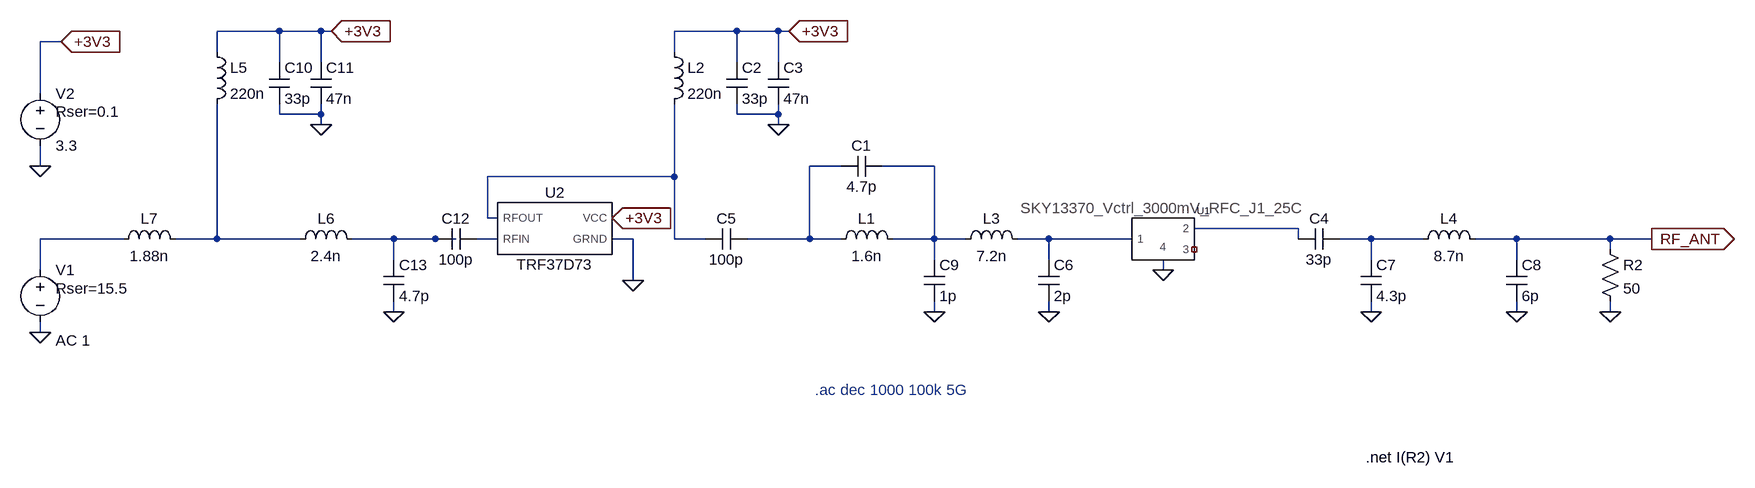
[diagram p0: schematic RF_Front_End_Ideal.asc]
RF_Front_End_Ideal.asc, the LTspice schematic file:
Version 4.1
SHEET 1 1608 680
WIRE -656 -192 -752 -192
WIRE -592 -192 -656 -192
WIRE -576 -192 -592 -192
WIRE 48 -192 -48 -192
WIRE 112 -192 48 -192
WIRE 128 -192 112 -192
WIRE -992 -176 -1024 -176
WIRE -752 -160 -752 -192
WIRE -48 -160 -48 -192
WIRE -656 -144 -656 -192
WIRE -592 -144 -592 -192
WIRE 48 -144 48 -192
WIRE 112 -144 112 -192
WIRE -1024 -96 -1024 -176
WIRE -656 -64 -656 -80
WIRE -592 -64 -592 -80
WIRE -592 -64 -656 -64
WIRE 48 -64 48 -80
WIRE 112 -64 112 -80
WIRE 112 -64 48 -64
WIRE -592 -48 -592 -64
WIRE 112 -48 112 -64
WIRE -1024 16 -1024 -16
WIRE 208 16 160 16
WIRE 352 16 272 16
WIRE -48 32 -48 -80
WIRE -48 32 -336 32
WIRE -336 96 -336 32
WIRE -320 96 -336 96
WIRE 912 112 752 112
WIRE -896 128 -1024 128
WIRE -752 128 -752 -80
WIRE -752 128 -816 128
WIRE -624 128 -752 128
WIRE -480 128 -544 128
WIRE -416 128 -480 128
WIRE -384 128 -416 128
WIRE -320 128 -352 128
WIRE -112 128 -144 128
WIRE -48 128 -48 32
WIRE 0 128 -48 128
WIRE 160 128 160 16
WIRE 160 128 64 128
WIRE 208 128 160 128
WIRE 352 128 352 16
WIRE 352 128 288 128
WIRE 400 128 352 128
WIRE 528 128 480 128
WIRE 656 128 528 128
WIRE 912 128 912 112
WIRE 1024 128 976 128
WIRE 1104 128 1024 128
WIRE 1248 128 1184 128
WIRE 1392 128 1248 128
WIRE 1456 128 1392 128
WIRE 1392 144 1392 128
WIRE -480 160 -480 128
WIRE 352 160 352 128
WIRE 528 160 528 128
WIRE 1024 160 1024 128
WIRE 1248 160 1248 128
WIRE -1024 176 -1024 128
WIRE 704 176 704 160
WIRE -112 192 -112 128
WIRE -480 240 -480 224
WIRE 352 240 352 224
WIRE 528 240 528 224
WIRE 1024 240 1024 224
WIRE 1248 240 1248 224
WIRE 1392 240 1392 224
WIRE -1024 272 -1024 256
FLAG 128 -192 +3V3
IOPIN 128 -192 In
FLAG 112 -48 0
FLAG 528 240 0
FLAG 1024 240 0
FLAG 1248 240 0
FLAG 1456 128 RF_ANT
IOPIN 1456 128 Out
FLAG -1024 272 0
FLAG 1392 240 0
FLAG 352 240 0
FLAG 704 176 0
FLAG -112 192 0
FLAG -576 -192 +3V3
IOPIN -576 -192 In
FLAG -592 -48 0
FLAG -480 240 0
FLAG -1024 16 0
FLAG -992 -176 +3V3
IOPIN -992 -176 In
FLAG -144 96 +3V3
IOPIN -144 96 In
SYMBOL ind 192 144 R270
WINDOW 0 32 56 VTop 2
WINDOW 3 5 56 VBottom 2
SYMATTR InstName L1
SYMATTR Value 1.6n
SYMATTR SpiceLine Rser=1m
SYMBOL cap 272 0 R90
WINDOW 0 0 32 VBottom 2
WINDOW 3 32 32 VTop 2
SYMATTR InstName C1
SYMATTR Value 4.7p
SYMBOL ind -64 -176 R0
SYMATTR InstName L2
SYMATTR Value 220n
SYMATTR SpiceLine Rser=1m
SYMBOL cap 32 -144 R0
SYMATTR InstName C2
SYMATTR Value 33p
SYMBOL cap 96 -144 R0
SYMATTR InstName C3
SYMATTR Value 47n
SYMBOL ind 384 144 R270
WINDOW 0 32 56 VTop 2
WINDOW 3 5 56 VBottom 2
SYMATTR InstName L3
SYMATTR Value 7.2n
SYMATTR SpiceLine Rser=1m
SYMBOL cap 64 112 R90
WINDOW 0 0 32 VBottom 2
WINDOW 3 32 32 VTop 2
SYMATTR InstName C5
SYMATTR Value 100p
SYMBOL cap 512 160 R0
SYMATTR InstName C6
SYMATTR Value 2p
SYMBOL ind 1088 144 R270
WINDOW 0 32 56 VTop 2
WINDOW 3 5 56 VBottom 2
SYMATTR InstName L4
SYMATTR Value 8.7n
SYMATTR SpiceLine Rser=1m
SYMBOL cap 1232 160 R0
SYMATTR InstName C8
SYMATTR Value 6p
SYMBOL cap 976 112 R90
WINDOW 0 0 32 VBottom 2
WINDOW 3 32 32 VTop 2
SYMATTR InstName C4
SYMATTR Value 33p
SYMBOL voltage -1024 160 R0
WINDOW 123 24 124 Left 2
WINDOW 39 24 44 Left 2
WINDOW 3 24 72 Left 2
SYMATTR Value2 AC 1
SYMATTR SpiceLine Rser=15.5
SYMATTR Value ""
SYMATTR InstName V1
SYMBOL cap 1008 160 R0
SYMATTR InstName C7
SYMATTR Value 4.3p
SYMBOL res 1376 128 R0
SYMATTR InstName R2
SYMATTR Value 50
SYMBOL cap 336 160 R0
SYMATTR InstName C9
SYMATTR Value 1p
SYMBOL SKY13370_Vctrl_3000mV_RFC_J1_25C 704 128 R0
SYMATTR InstName U1
SYMBOL Spice_Models\\TRF37D73 -240 112 R0
SYMATTR InstName U2
SYMBOL ind -768 -176 R0
SYMATTR InstName L5
SYMATTR Value 220n
SYMATTR SpiceLine Rser=1m
SYMBOL cap -672 -144 R0
SYMATTR InstName C10
SYMATTR Value 33p
SYMBOL cap -608 -144 R0
SYMATTR InstName C11
SYMATTR Value 47n
SYMBOL cap -352 112 R90
WINDOW 0 0 32 VBottom 2
WINDOW 3 32 32 VTop 2
SYMATTR InstName C12
SYMATTR Value 100p
SYMBOL ind -640 144 R270
WINDOW 0 32 56 VTop 2
WINDOW 3 5 56 VBottom 2
SYMATTR InstName L6
SYMATTR Value 2.4n
SYMATTR SpiceLine Rser=1m
SYMBOL cap -496 160 R0
SYMATTR InstName C13
SYMATTR Value 4.7p
SYMBOL ind -912 144 R270
WINDOW 0 32 56 VTop 2
WINDOW 3 5 56 VBottom 2
SYMATTR InstName L7
SYMATTR Value 1.88n
SYMATTR SpiceLine Rser=1m
SYMBOL voltage -1024 -112 R0
WINDOW 123 0 0 Left 0
WINDOW 39 24 44 Left 2
SYMATTR SpiceLine Rser=0.1
SYMATTR InstName V2
SYMATTR Value 3.3
TEXT 168 360 Left 2 ;.ac dec 1000 100k 5G
TEXT 1016 464 Left 2 !.net I(R2) V1

The netlist it stands for:
* RF_Front_End_Ideal.asc
L1 N001 N002 1.6n Rser=1m
C1 N002 N001 4.7p
L2 +3V3 N003 220n Rser=1m
C2 +3V3 0 33p
C3 +3V3 0 47n
L3 N002 N009 7.2n Rser=1m
C5 N001 N003 100p
C6 N009 0 2p
L4 N010 RF_ANT 8.7n Rser=1m
C8 RF_ANT 0 6p
C4 N010 N004 33p
V1 N005 0 AC 1 Rser=15.5
C7 N010 0 4.3p
R2 RF_ANT 0 50
C9 N002 0 1p
X§U1 N009 N004 NC_01 0 SKY13370_Vctrl_3000mV_RFC_J1_25C  ; pins 1 2 3 4
X§U2 N003 N008 +3V3 0 TRF37D73  ; pins RFOUT RFIN VCC GRND
L5 +3V3 N006 220n Rser=1m
C10 +3V3 0 33p
C11 +3V3 0 47n
C12 N008 N007 100p
L6 N006 N007 2.4n Rser=1m
C13 N007 0 4.7p
L7 N005 N006 1.88n Rser=1m
V2 +3V3 0 3.3 Rser=0.1
* .ac dec 1000 100k 5G
.net I(R2) V1
.lib SKY13370_Vctrl_3000mV_RFC_J1_25C.inc
.backanno
.end